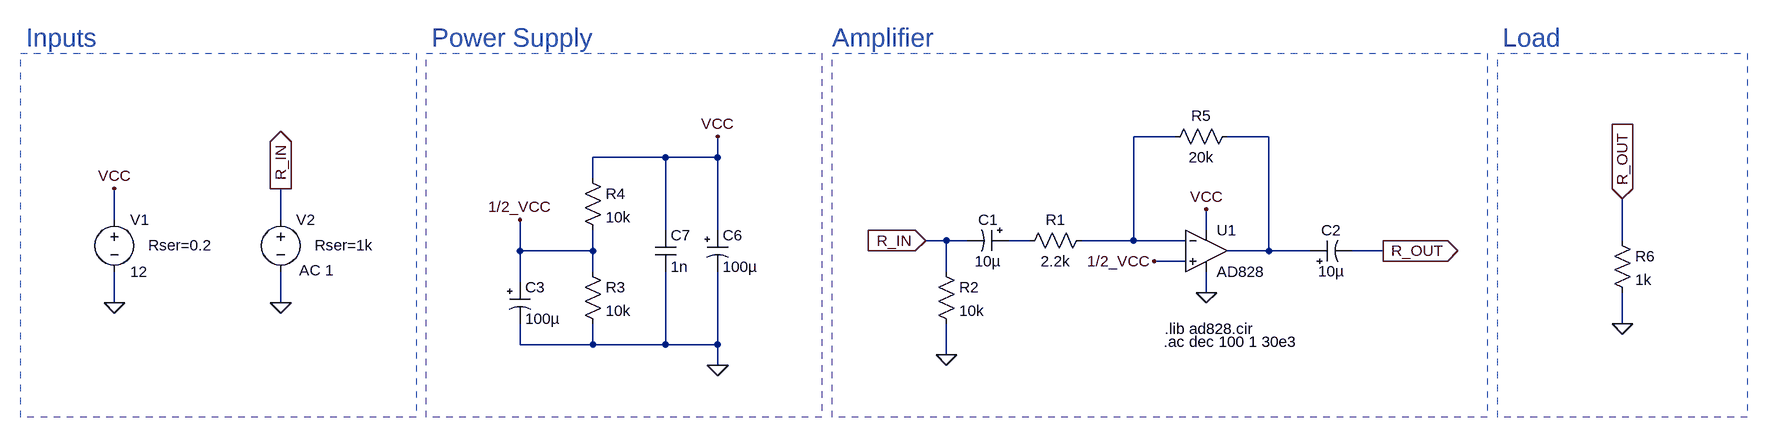
[diagram p0: schematic Simulation_AudioPreamp.asc]
Simulation_AudioPreamp.asc, the LTspice schematic file:
Version 4
SHEET 1 1700 916
WIRE 640 480 576 480
WIRE 784 480 720 480
WIRE -144 512 -256 512
WIRE -64 512 -64 480
WIRE -64 512 -144 512
WIRE -256 544 -256 512
WIRE -992 608 -992 560
WIRE -736 608 -736 560
WIRE -144 624 -144 512
WIRE -64 624 -64 512
WIRE 688 624 688 592
WIRE 288 640 256 640
WIRE 320 640 288 640
WIRE 416 640 384 640
WIRE 576 640 576 480
WIRE 576 640 496 640
WIRE 656 640 576 640
WIRE 1328 640 1328 576
WIRE -368 656 -368 608
WIRE -256 656 -256 624
WIRE -256 656 -368 656
WIRE 784 656 784 480
WIRE 784 656 720 656
WIRE 848 656 784 656
WIRE 960 656 912 656
WIRE 656 672 608 672
WIRE -256 688 -256 656
WIRE 288 688 288 640
WIRE -368 704 -368 656
WIRE 688 720 688 688
WIRE -992 736 -992 688
WIRE -736 736 -736 688
WIRE 1328 768 1328 720
WIRE -368 800 -368 768
WIRE -256 800 -256 768
WIRE -256 800 -368 800
WIRE -144 800 -144 688
WIRE -144 800 -256 800
WIRE -64 800 -64 688
WIRE -64 800 -144 800
WIRE 288 816 288 768
WIRE -64 832 -64 800
FLAG -992 736 0
FLAG -992 560 VCC
FLAG -64 832 0
FLAG -64 480 VCC
FLAG -368 608 1/2_VCC
FLAG 608 672 1/2_VCC
FLAG 688 592 VCC
FLAG 688 720 0
FLAG 256 640 R_IN
IOPIN 256 640 In
FLAG 288 816 0
FLAG 960 656 R_OUT
IOPIN 960 656 Out
FLAG -736 736 0
FLAG -736 560 R_IN
IOPIN -736 560 Out
FLAG 1328 768 0
FLAG 1328 576 R_OUT
IOPIN 1328 576 In
SYMBOL voltage -992 592 R0
WINDOW 123 0 0 Left 0
WINDOW 39 52 55 Left 2
SYMATTR InstName V1
SYMATTR Value 12
SYMATTR SpiceLine Rser=0.2
SYMBOL polcap -80 624 R0
WINDOW 3 24 56 Left 2
SYMATTR InstName C6
SYMATTR Value 100µ
SYMATTR Description Capacitor
SYMATTR Type cap
SYMATTR SpiceLine V=16 Irms=265m Rser=0.35 Lser=0 mfg="Nichicon" pn="UPL1C101MPH" type="Al electrolytic"
SYMBOL cap -160 624 R0
SYMATTR InstName C7
SYMATTR Value 1n
SYMATTR SpiceLine V=50 Irms=0 Rser=0 Lser=0 mfg="Murata" pn="GRM1555C1H102JA01" type="C0G"
SYMBOL res -272 528 R0
SYMATTR InstName R4
SYMATTR Value 10k
SYMBOL res -272 672 R0
SYMATTR InstName R3
SYMATTR Value 10k
SYMBOL polcap -384 704 R0
WINDOW 3 24 56 Left 2
SYMATTR InstName C3
SYMATTR Value 100µ
SYMATTR Description Capacitor
SYMATTR Type cap
SYMATTR SpiceLine V=16 Irms=265m Rser=0.35 Lser=0 mfg="Nichicon" pn="UPL1C101MPH" type="Al electrolytic"
SYMBOL polcap 384 624 R90
WINDOW 0 0 32 VBottom 2
WINDOW 3 32 32 VTop 2
SYMATTR InstName C1
SYMATTR Value 10µ
SYMATTR Description Capacitor
SYMATTR Type cap
SYMATTR SpiceLine V=16 Irms=2.12132 Rser=0.06 Lser=0 mfg="KEMET" pn="A700V106M016ATE060" type="Al electrolytic"
SYMBOL res 512 624 R90
WINDOW 0 0 56 VBottom 2
WINDOW 3 32 56 VTop 2
SYMATTR InstName R1
SYMATTR Value 2.2k
SYMBOL res 272 672 R0
SYMATTR InstName R2
SYMATTR Value 10k
SYMBOL res 736 464 R90
WINDOW 0 0 56 VBottom 2
WINDOW 3 32 56 VTop 2
SYMATTR InstName R5
SYMATTR Value 20k
SYMBOL polcap 848 672 R270
WINDOW 0 32 32 VTop 2
WINDOW 3 0 32 VBottom 2
SYMATTR InstName C2
SYMATTR Value 10µ
SYMATTR Description Capacitor
SYMATTR Type cap
SYMATTR SpiceLine V=16 Irms=2.12132 Rser=0.06 Lser=0 mfg="KEMET" pn="A700V106M016ATE060" type="Al electrolytic"
SYMBOL voltage -736 592 R0
WINDOW 123 28 94 Left 2
WINDOW 39 52 55 Left 2
SYMATTR InstName V2
SYMATTR Value ""
SYMATTR Value2 AC 1
SYMATTR SpiceLine Rser=1k
SYMBOL res 1312 624 R0
SYMATTR InstName R6
SYMATTR Value 1k
SYMBOL OpAmps\\opamp2 688 592 R0
SYMATTR InstName U1
SYMATTR Value AD828
TEXT 624 776 Left 2 !.lib ad828.cir
TEXT 622 796 Left 2 !.ac dec 100 1 30e3
TEXT 1144 328 Left 4 ;Load
TEXT 112 328 Left 4 ;Amplifier
TEXT -504 328 Left 4 ;Power Supply
TEXT -1128 328 Left 4 ;Inputs
RECTANGLE Normal 96 912 -512 352 2
RECTANGLE Normal -528 912 -1136 352 2
RECTANGLE Normal 1120 912 112 352 2
RECTANGLE Normal 1520 912 1136 352 2

The netlist it stands for:
* Simulation_AudioPreamp.asc
V1 VCC 0 12 Rser=0.2
C6 VCC 0 100µ V=16 Irms=265m Rser=0.35 Lser=0 mfg="Nichicon" pn="UPL1C101MPH" type="Al electrolytic"
C7 VCC 0 1n V=50 Irms=0 Rser=0 Lser=0 mfg="Murata" pn="GRM1555C1H102JA01" type="C0G"
R4 VCC 1/2_VCC 10k
R3 1/2_VCC 0 10k
C3 1/2_VCC 0 100µ V=16 Irms=265m Rser=0.35 Lser=0 mfg="Nichicon" pn="UPL1C101MPH" type="Al electrolytic"
C1 N003 R_IN 10µ V=16 Irms=2.12132 Rser=0.06 Lser=0 mfg="KEMET" pn="A700V106M016ATE060" type="Al electrolytic"
R1 N001 N003 2.2k
R2 R_IN 0 10k
R5 N002 N001 20k
C2 N002 R_OUT 10µ V=16 Irms=2.12132 Rser=0.06 Lser=0 mfg="KEMET" pn="A700V106M016ATE060" type="Al electrolytic"
V2 R_IN 0 AC 1 Rser=1k
R6 R_OUT 0 1k
XU1 1/2_VCC N001 VCC 0 N002 AD828  ; pins In+ In- V+ V- OUT
.lib ad828.cir
.ac dec 100 1 30e3
* Load
* Amplifier
* Power Supply
* Inputs
.backanno
.end